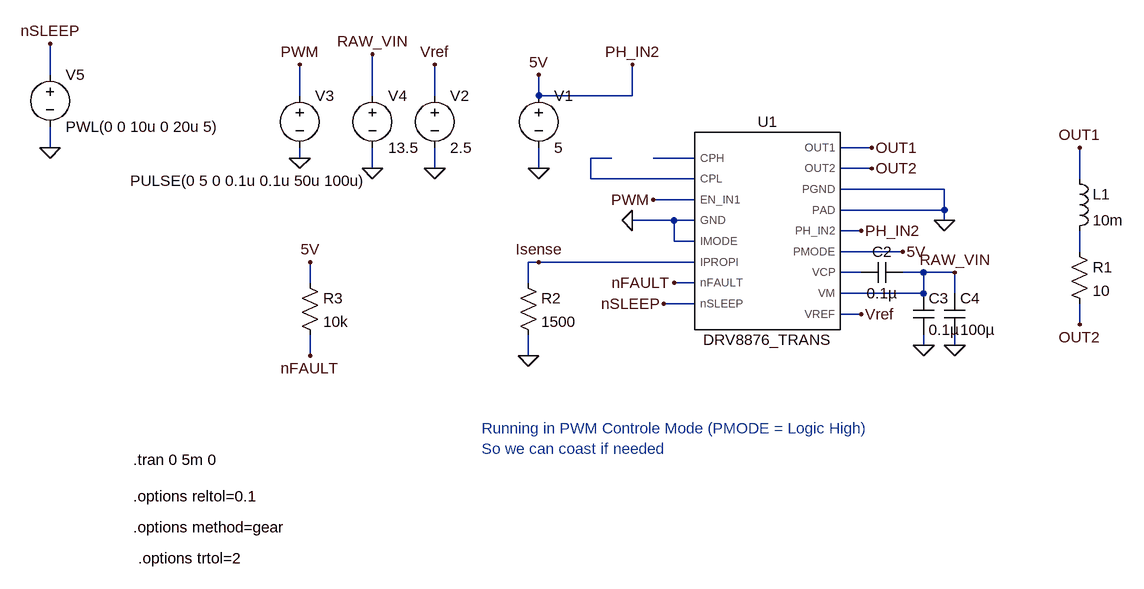
[diagram p0: schematic Magnetourqer.asc]
Magnetourqer.asc, the LTspice schematic file:
Version 4.1
SHEET 1 880 680
WIRE -1248 -160 -1248 -208
WIRE -864 -128 -864 -176
WIRE -752 -128 -752 -192
WIRE -656 -128 -656 -176
WIRE -496 -128 -496 -160
WIRE -352 -128 -352 -176
WIRE -352 -128 -496 -128
WIRE -1248 -48 -1248 -80
WIRE 16 -48 -32 -48
WIRE -864 -32 -864 -48
WIRE -384 -32 -416 -32
WIRE -256 -32 -320 -32
WIRE -752 -16 -752 -48
WIRE -656 -16 -656 -48
WIRE -496 -16 -496 -48
WIRE 16 -16 -32 -16
WIRE -416 0 -416 -32
WIRE -256 0 -416 0
WIRE 336 0 336 -48
WIRE 128 16 -32 16
WIRE -256 32 -320 32
WIRE 128 48 128 16
WIRE 128 48 -32 48
WIRE -288 64 -352 64
WIRE -256 64 -288 64
WIRE 128 64 128 48
WIRE 0 80 -32 80
WIRE -288 96 -288 64
WIRE -256 96 -288 96
WIRE 64 112 -32 112
WIRE 336 112 336 80
WIRE -496 128 -512 128
WIRE -256 128 -496 128
WIRE 0 144 -32 144
WIRE 96 144 64 144
WIRE 144 144 96 144
WIRE -848 160 -848 128
WIRE -512 160 -512 128
WIRE -256 160 -288 160
WIRE 96 176 96 144
WIRE 96 176 -32 176
WIRE 144 176 144 144
WIRE -256 192 -304 192
WIRE 0 208 -32 208
WIRE 336 224 336 192
WIRE 96 256 96 240
WIRE 144 256 144 240
WIRE -848 272 -848 240
WIRE -512 272 -512 240
FLAG 16 -48 OUT1
FLAG 16 -16 OUT2
FLAG 336 -48 OUT1
FLAG 336 224 OUT2
FLAG 128 64 0
FLAG -496 -16 0
FLAG -496 -160 5V
FLAG -656 -16 0
FLAG -656 -176 Vref
FLAG 0 208 Vref
FLAG -512 272 0
FLAG -496 128 Isense
FLAG -352 64 0
FLAG -320 32 PWM
FLAG -864 -32 0
FLAG -864 -176 PWM
FLAG 0 80 PH_IN2
FLAG 64 112 5V
FLAG -352 -176 PH_IN2
FLAG -288 160 nFAULT
FLAG -848 272 nFAULT
FLAG -848 128 5V
FLAG 96 256 0
FLAG 144 256 0
FLAG -752 -16 0
FLAG -752 -192 RAW_VIN
FLAG 144 144 RAW_VIN
FLAG -1248 -48 0
FLAG -1248 -208 nSLEEP
FLAG -304 192 nSLEEP
SYMBOL ind 320 -16 R0
SYMATTR InstName L1
SYMATTR Value 10m
SYMBOL DRV8876_TRANS -144 80 R0
SYMATTR InstName U1
SYMBOL res 320 96 R0
SYMATTR InstName R1
SYMATTR Value 10
SYMBOL voltage -496 -144 R0
WINDOW 123 0 0 Left 0
WINDOW 39 0 0 Left 0
SYMATTR InstName V1
SYMATTR Value 5
SYMBOL voltage -656 -144 R0
WINDOW 123 0 0 Left 0
WINDOW 39 0 0 Left 0
SYMATTR InstName V2
SYMATTR Value 2.5
SYMBOL res -528 144 R0
SYMATTR InstName R2
SYMATTR Value 1500
SYMBOL voltage -864 -144 R0
WINDOW 3 -261 147 Left 2
WINDOW 123 0 0 Left 0
WINDOW 39 0 0 Left 0
SYMATTR Value PULSE(0 5 0 0.1u 0.1u 50u 100u)
SYMATTR InstName V3
SYMBOL res -864 144 R0
SYMATTR InstName R3
SYMATTR Value 10k
SYMBOL cap 0 160 R270
WINDOW 0 32 32 VTop 2
WINDOW 3 0 32 VBottom 2
SYMATTR InstName C2
SYMATTR Value 0.1µ
SYMBOL cap 80 176 R0
SYMATTR InstName C3
SYMATTR Value 0.1µ
SYMBOL cap 128 176 R0
SYMATTR InstName C4
SYMATTR Value 100µ
SYMBOL voltage -752 -144 R0
WINDOW 123 0 0 Left 0
WINDOW 39 0 0 Left 0
SYMATTR InstName V4
SYMATTR Value 13.5
SYMBOL voltage -1248 -176 R0
WINDOW 123 0 0 Left 0
WINDOW 39 0 0 Left 0
SYMATTR InstName V5
SYMATTR Value PWL(0 0 10u 0 20u 5)
TEXT -584 384 Left 2 ;Running in PWM Controle Mode (PMODE = Logic High)\nSo we can coast if needed
TEXT -1120 432 Left 2 !.tran 0 5m 0
TEXT -1120 488 Left 2 !.options reltol=0.1
TEXT -1120 536 Left 2 !.options method=gear
TEXT -1112 584 Left 2 !.options trtol=2

The netlist it stands for:
* Magnetourqer.asc
L1 OUT1 N003 10m
X§U1 N002 N001 PWM 0 0 Isense nFAULT nSLEEP OUT1 OUT2 0 0 PH_IN2 PH_IN2 N004 RAW_VIN Vref DRV8876_TRANS  ; pins CPH CPL EN_IN1 GND IMODE IPROPI nFAULT nSLEEP OUT1 OUT2 PGND PAD PH_IN2 PMODE VCP VM VREF
R1 N003 OUT2 10
V1 PH_IN2 0 5
V2 Vref 0 2.5
R2 Isense 0 1500
V3 PWM 0 PULSE(0 5 0 0.1u 0.1u 50u 100u)
R3 PH_IN2 nFAULT 10k
C2 N004 RAW_VIN 0.1µ
C3 RAW_VIN 0 0.1µ
C4 RAW_VIN 0 100µ
V4 RAW_VIN 0 13.5
V5 nSLEEP 0 PWL(0 0 10u 0 20u 5)
* Running in PWM Controle Mode (PMODE = Logic High)
* So we can coast if needed
.tran 0 5m 0
.options reltol=0.1
.options method=gear
.options trtol=2
.lib C:\Main Engineering\Engineering\Project Genesis EE Notes\ADCS\Magnetourqers\LTSPICE\DRV8876_TRANS.lib
.backanno
.end